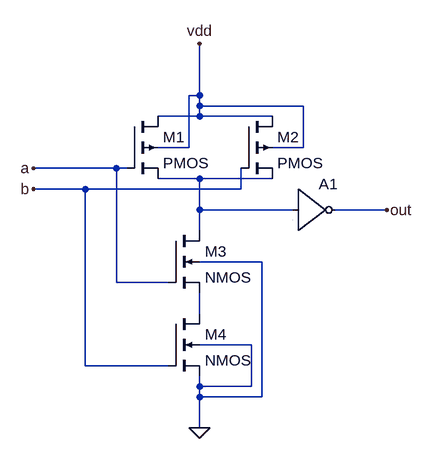
[diagram p0: schematic cmos_2input_and_gate.asc]
cmos_2input_and_gate.asc, the LTspice schematic file:
Version 4
SHEET 1 880 680
WIRE 192 48 192 -32
WIRE 192 48 176 48
WIRE 192 64 192 48
WIRE 352 64 192 64
WIRE 192 80 192 64
WIRE 192 80 128 80
WIRE 304 80 192 80
WIRE 176 128 176 48
WIRE 176 128 128 128
WIRE 352 128 352 64
WIRE 352 128 304 128
WIRE 64 160 -64 160
WIRE 80 160 64 160
WIRE 192 176 128 176
WIRE 304 176 192 176
WIRE 16 192 -64 192
WIRE 256 192 256 160
WIRE 256 192 16 192
WIRE 192 224 192 176
WIRE 336 224 192 224
WIRE 480 224 400 224
WIRE 192 256 192 224
WIRE 288 304 192 304
WIRE 64 336 64 160
WIRE 144 336 64 336
WIRE 192 384 192 352
WIRE 272 432 192 432
WIRE 16 464 16 192
WIRE 144 464 16 464
WIRE 192 496 192 480
WIRE 272 496 272 432
WIRE 272 496 192 496
WIRE 192 512 192 496
WIRE 288 512 288 304
WIRE 288 512 192 512
WIRE 192 560 192 512
FLAG 192 560 0
FLAG 192 -32 vdd
FLAG -64 160 a
FLAG -64 192 b
FLAG 480 224 out
SYMBOL pmos4 80 80 R0
SYMATTR InstName M1
SYMBOL pmos4 256 80 R0
SYMATTR InstName M2
SYMBOL nmos4 144 256 R0
SYMATTR InstName M3
SYMBOL nmos4 144 384 R0
SYMATTR InstName M4
SYMBOL Digital\\inv 336 160 R0
SYMATTR InstName A1

The netlist it stands for:
* cmos_2input_and_gate.asc
M1 vdd a N001 vdd PMOS
M2 vdd b N001 vdd PMOS
M3 N001 a N002 0 NMOS
M4 N002 b 0 0 NMOS
A1 N001 0 0 0 0 out 0 0 BUF
.model NMOS NMOS
.model PMOS PMOS
.lib standard.mos
.backanno
.end